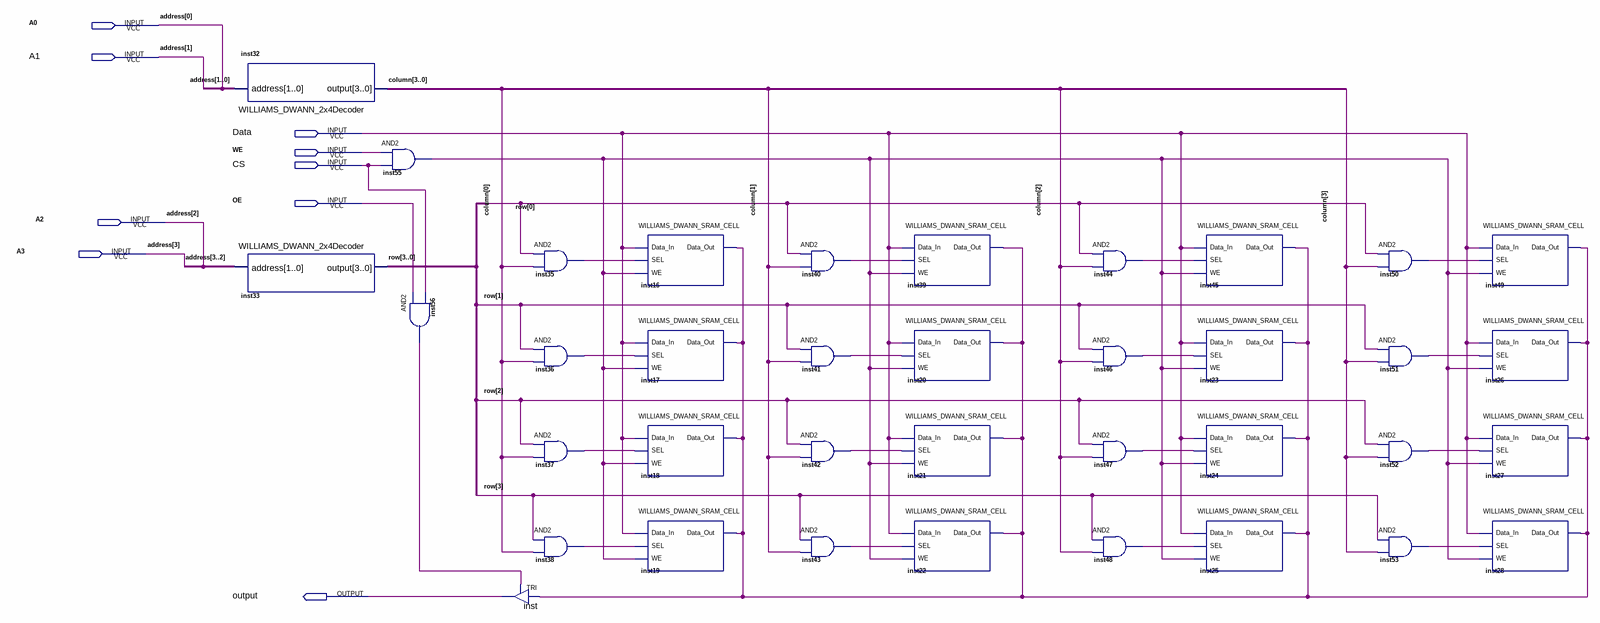
[diagram p0: schematic sheet]
// Quartus schematic WILLIAMS_DWANN_SRAM_16x1.bdf as structural Verilog: 37 symbols, 9 pins
module WILLIAMS_DWANN_SRAM_16x1 (
  input  A0,
  input  A1,
  input  Data,
  input  WE,
  input  CS,
  input  OE,
  input  A2,
  input  A3,
  output \output 
);

  wire inst16_data_out, inst35_out, inst36_out, inst37_out, inst38_out, inst40_out, inst41_out, inst42_out,
       inst43_out, inst44_out, inst46_out, inst47_out, inst48_out, inst50_out, inst51_out, inst52_out,
       inst53_out, inst55_out, inst56_out;
  wire [3:0] column, row;

  WILLIAMS_DWANN_2x4Decoder inst32 (.address({A1, A0}), .\output (column));
  WILLIAMS_DWANN_2x4Decoder inst33 (.address({A3, A2}), .\output (row));
  and inst55 (inst55_out, WE, CS);
  and inst56 (inst56_out, OE, CS);
  TRI inst (.IN(inst16_data_out), .OE(inst56_out), .OUT(\output ));
  and inst35 (inst35_out, row[0], column[0]);
  and inst36 (inst36_out, row[1], column[0]);
  and inst37 (inst37_out, row[2], column[0]);
  and inst38 (inst38_out, row[3], column[0]);
  WILLIAMS_DWANN_SRAM_CELL inst16 (.Data_In(Data), .SEL(inst35_out), .WE(inst55_out), .Data_Out(inst16_data_out));
  WILLIAMS_DWANN_SRAM_CELL inst17 (.Data_In(Data), .SEL(inst36_out), .WE(inst55_out), .Data_Out(inst16_data_out));
  WILLIAMS_DWANN_SRAM_CELL inst18 (.Data_In(Data), .SEL(inst37_out), .WE(inst55_out), .Data_Out(inst16_data_out));
  WILLIAMS_DWANN_SRAM_CELL inst19 (.Data_In(Data), .SEL(inst38_out), .WE(inst55_out), .Data_Out(inst16_data_out));
  and inst40 (inst40_out, row[0], column[1]);
  and inst41 (inst41_out, row[1], column[1]);
  and inst42 (inst42_out, row[2], column[1]);
  and inst43 (inst43_out, row[3], column[1]);
  WILLIAMS_DWANN_SRAM_CELL inst39 (.Data_In(Data), .SEL(inst40_out), .WE(inst55_out), .Data_Out(inst16_data_out));
  WILLIAMS_DWANN_SRAM_CELL inst20 (.Data_In(Data), .SEL(inst41_out), .WE(inst55_out), .Data_Out(inst16_data_out));
  WILLIAMS_DWANN_SRAM_CELL inst21 (.Data_In(Data), .SEL(inst42_out), .WE(inst55_out), .Data_Out(inst16_data_out));
  WILLIAMS_DWANN_SRAM_CELL inst22 (.Data_In(Data), .SEL(inst43_out), .WE(inst55_out), .Data_Out(inst16_data_out));
  and inst44 (inst44_out, row[0], column[2]);
  and inst46 (inst46_out, row[1], column[2]);
  and inst47 (inst47_out, row[2], column[2]);
  and inst48 (inst48_out, row[3], column[2]);
  WILLIAMS_DWANN_SRAM_CELL inst45 (.Data_In(Data), .SEL(inst44_out), .WE(inst55_out), .Data_Out(inst16_data_out));
  WILLIAMS_DWANN_SRAM_CELL inst23 (.Data_In(Data), .SEL(inst46_out), .WE(inst55_out), .Data_Out(inst16_data_out));
  WILLIAMS_DWANN_SRAM_CELL inst24 (.Data_In(Data), .SEL(inst47_out), .WE(inst55_out), .Data_Out(inst16_data_out));
  WILLIAMS_DWANN_SRAM_CELL inst25 (.Data_In(Data), .SEL(inst48_out), .WE(inst55_out), .Data_Out(inst16_data_out));
  and inst50 (inst50_out, row[0], column[3]);
  and inst51 (inst51_out, row[1], column[3]);
  and inst52 (inst52_out, row[2], column[3]);
  and inst53 (inst53_out, row[3], column[3]);
  WILLIAMS_DWANN_SRAM_CELL inst49 (.Data_In(Data), .SEL(inst50_out), .WE(inst55_out), .Data_Out(inst16_data_out));
  WILLIAMS_DWANN_SRAM_CELL inst26 (.Data_In(Data), .SEL(inst51_out), .WE(inst55_out), .Data_Out(inst16_data_out));
  WILLIAMS_DWANN_SRAM_CELL inst27 (.Data_In(Data), .SEL(inst52_out), .WE(inst55_out), .Data_Out(inst16_data_out));
  WILLIAMS_DWANN_SRAM_CELL inst28 (.Data_In(Data), .SEL(inst53_out), .WE(inst55_out), .Data_Out(inst16_data_out));

  // Other names for the same wires on the sheet: address[3:0] = {A3, A2, A1, A0}
endmodule
